# Altium schematic sheet 00_ADCS_TOP.SchDoc
size A4; SheetNumber: 1; SheetTotal: 16
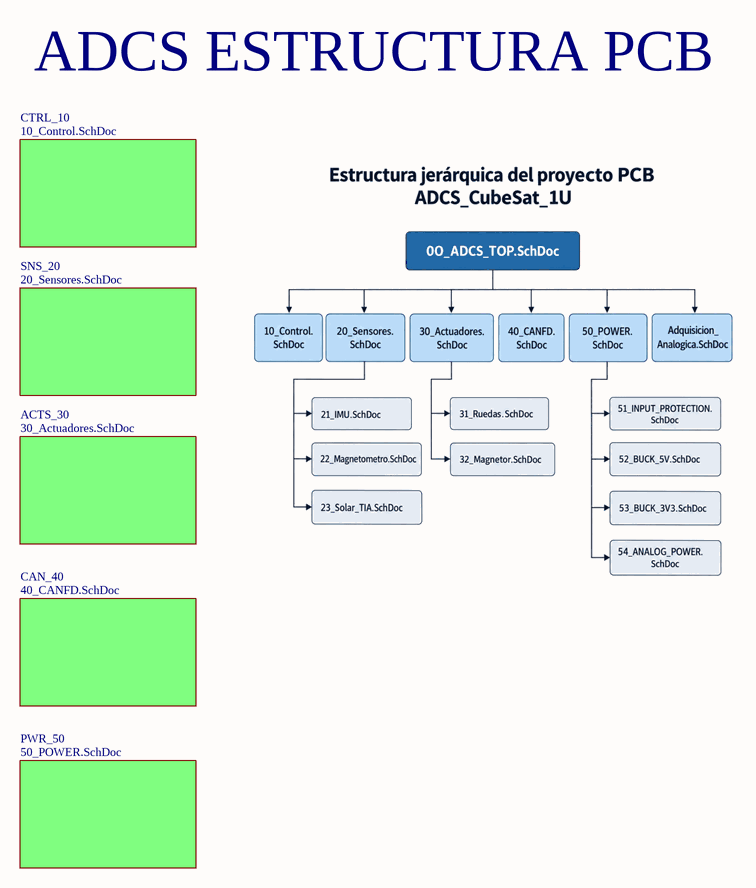
[diagram p0: 00_ADCS_TOP.SchDoc]

## Sub-sheets
ACTS_30 = 30_Actuadores.SchDoc: no entries
CAN_40 = 40_CANFD.SchDoc: no entries
CTRL_10 = 10_Control.SchDoc: no entries
PWR_50 = 50_POWER.SchDoc: no entries
SNS_20 = 20_Sensores.SchDoc: no entries

## Notes on the sheet
- ADCS ESTRUCTURA PCB